# Altium schematic sheet PowerPanel_5_Fans_LEDs_IO.SchDoc
size 594 x 420 mm; SheetNumber: 6; SheetTotal: 6
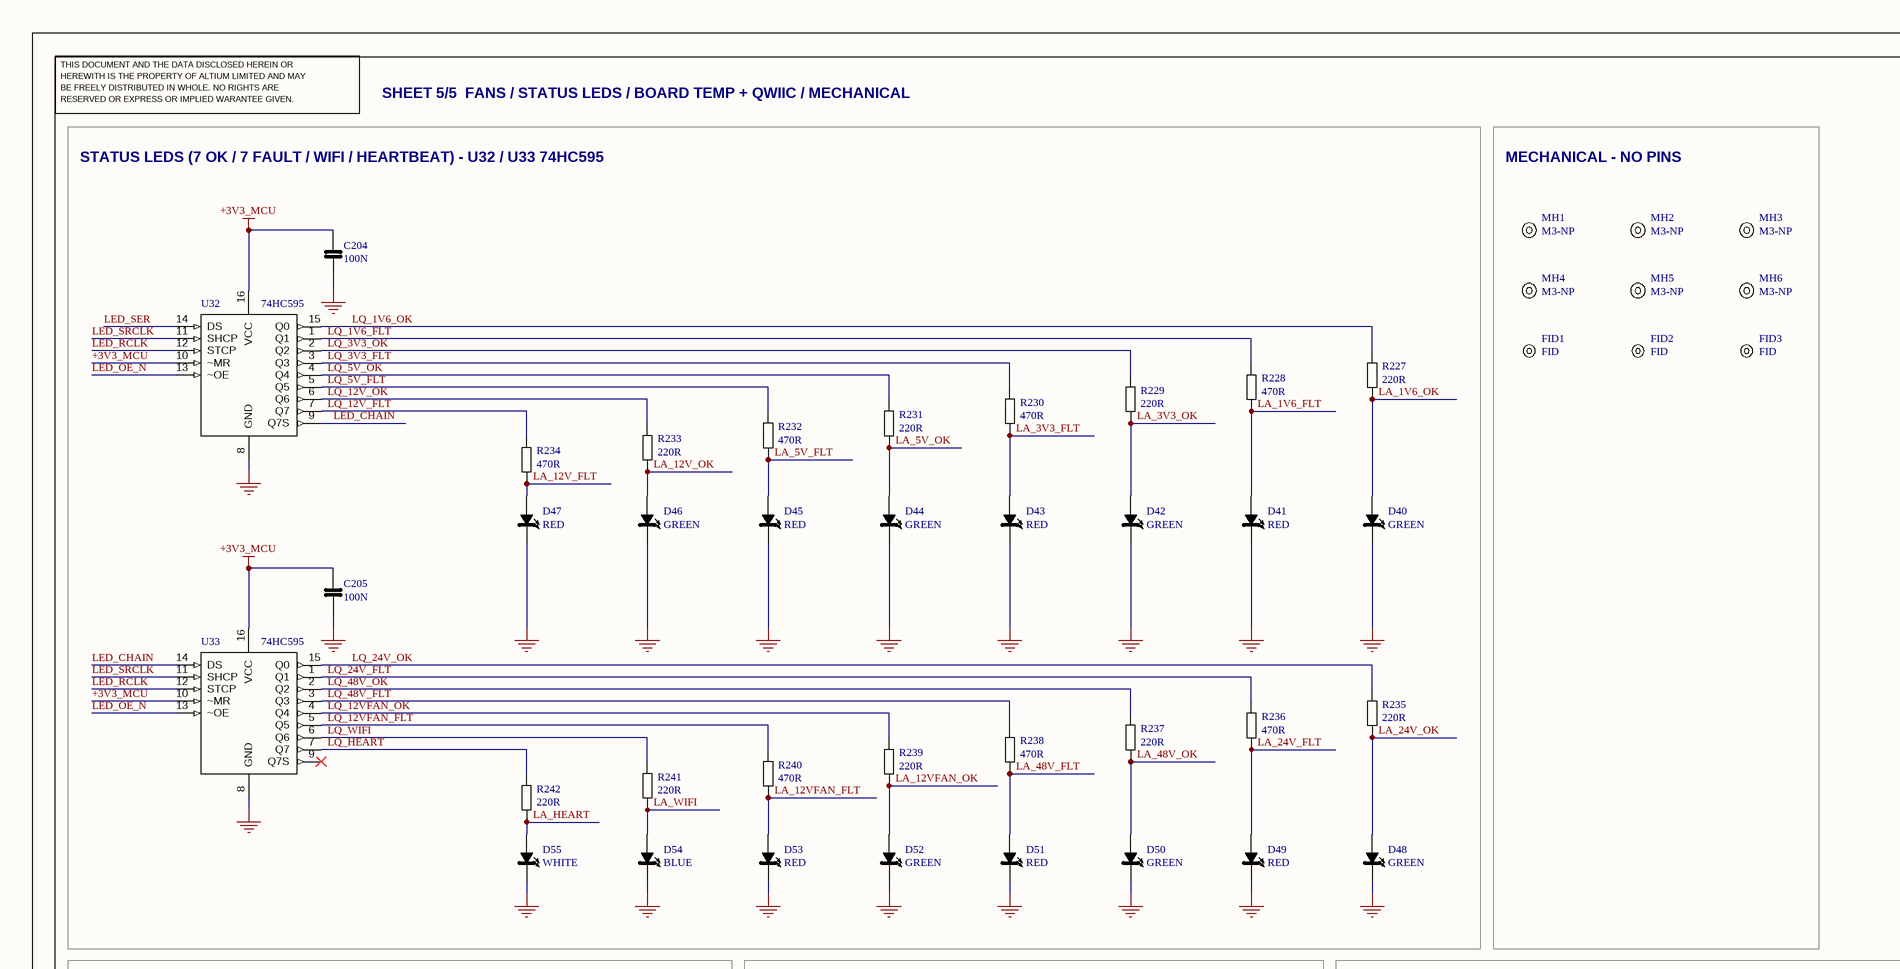
[diagram p0: PowerPanel_5_Fans_LEDs_IO.SchDoc, top left]
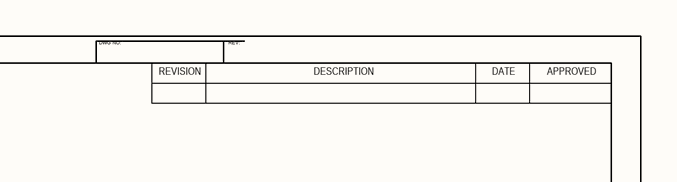
[diagram p1: PowerPanel_5_Fans_LEDs_IO.SchDoc, top right]
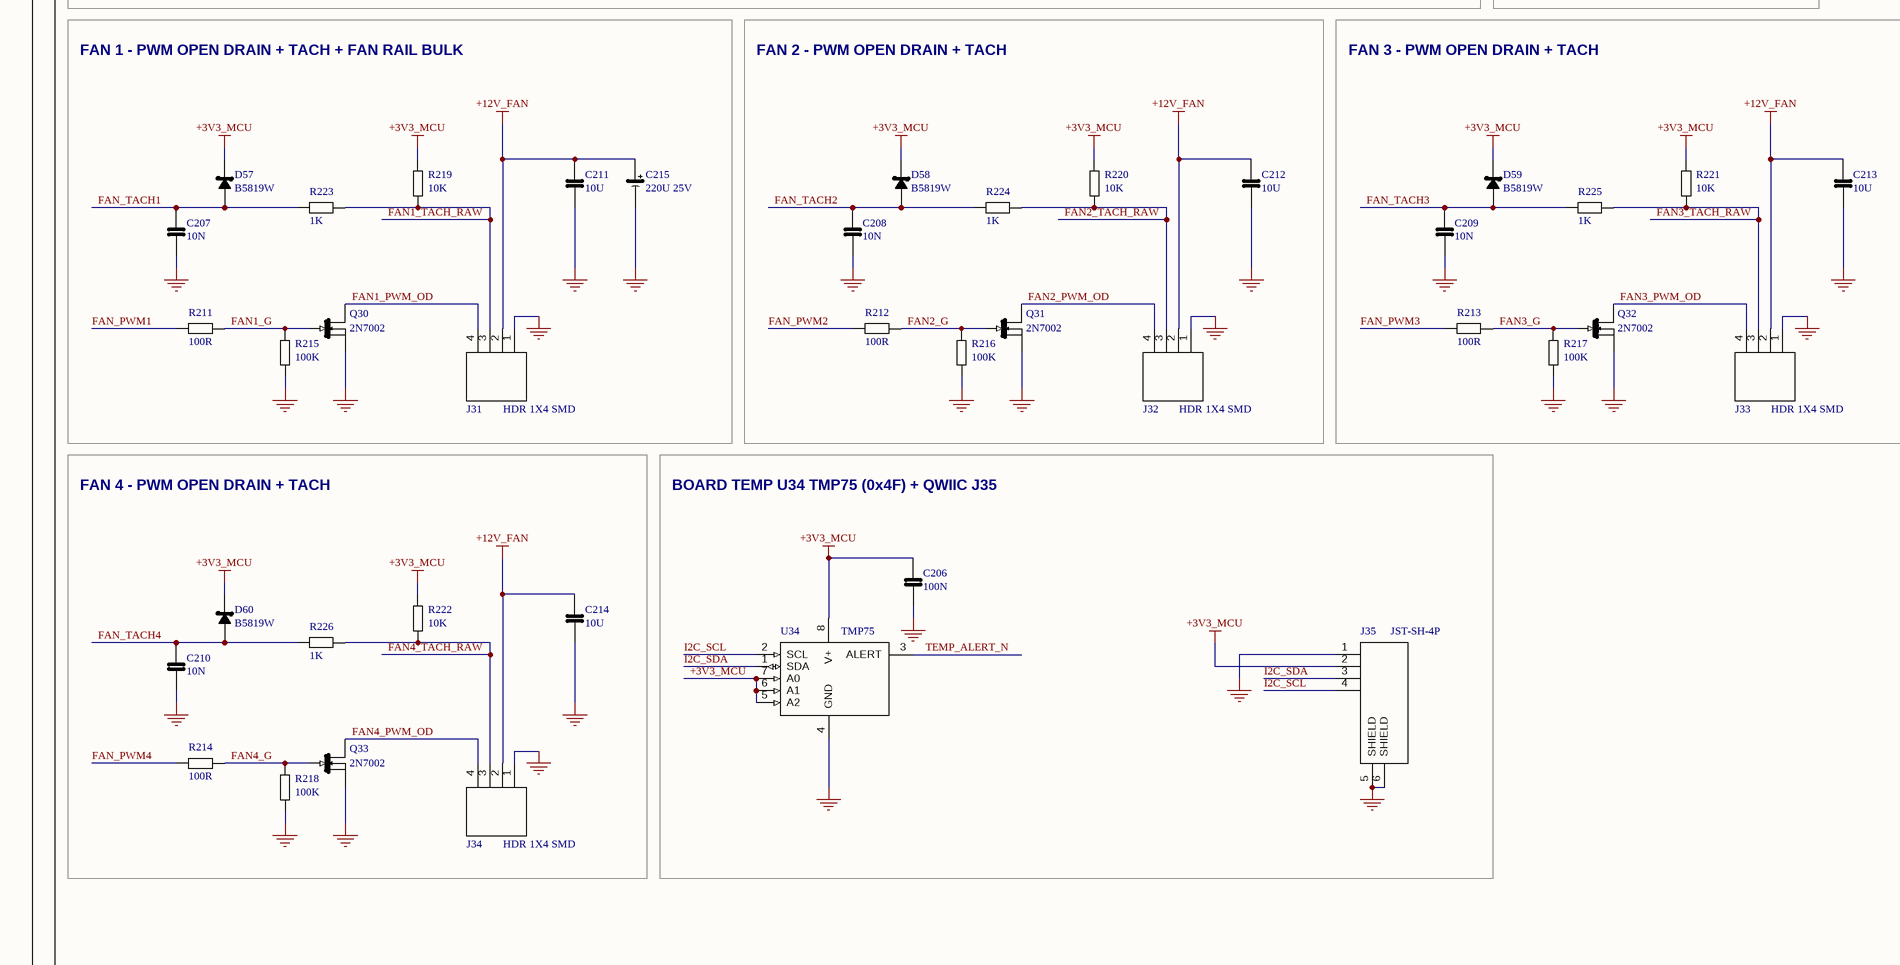
[diagram p2: PowerPanel_5_Fans_LEDs_IO.SchDoc, bottom left]
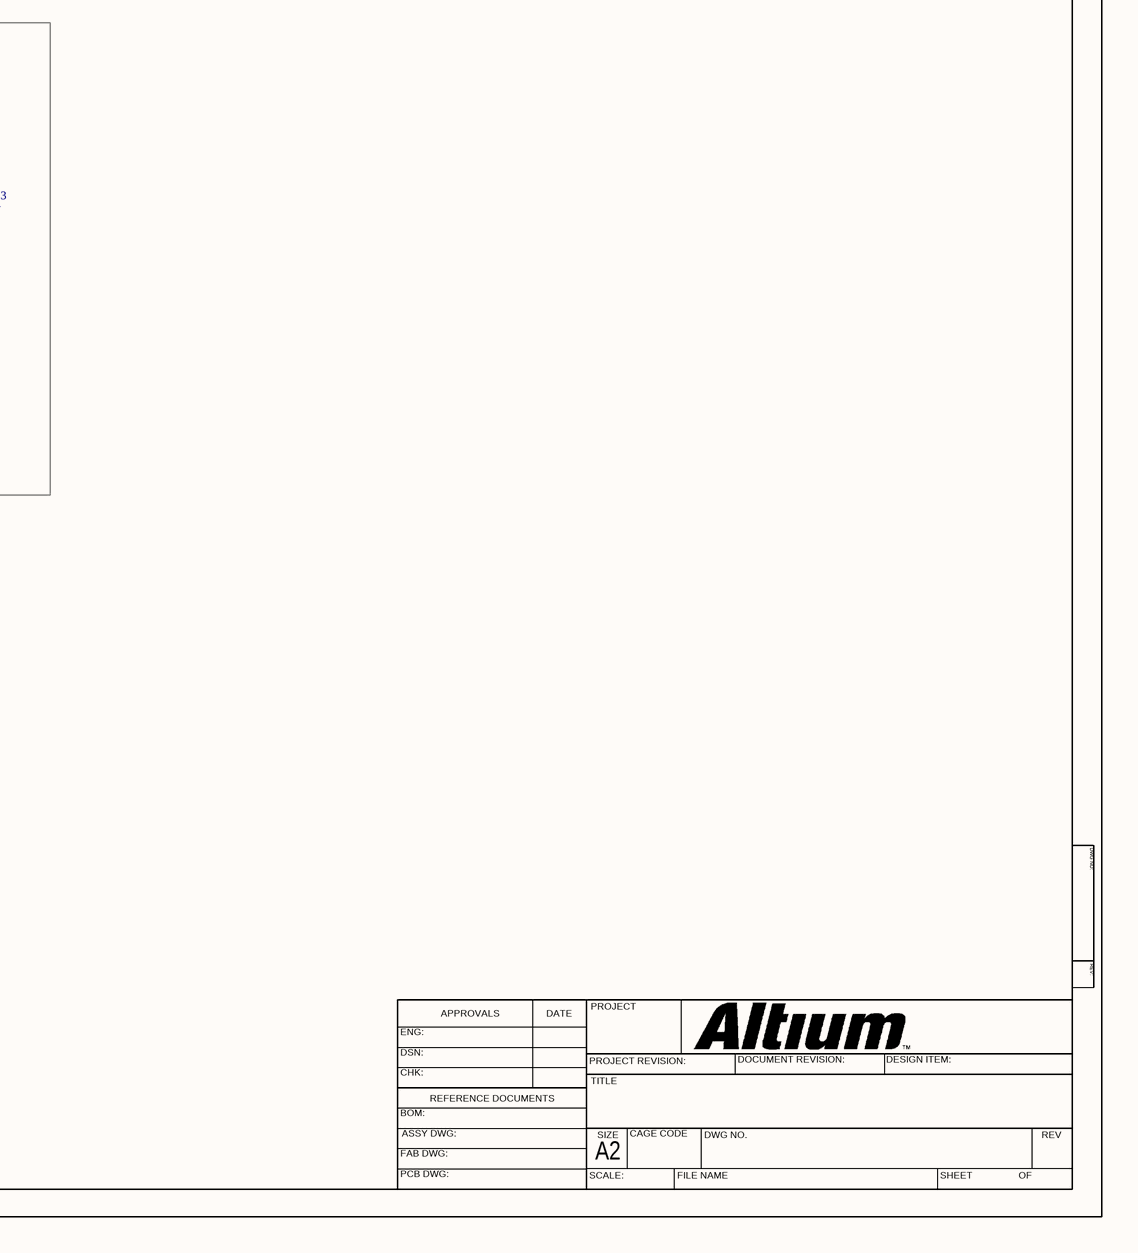
[diagram p3: PowerPanel_5_Fans_LEDs_IO.SchDoc, bottom right]

## Parts
C204  100N  [CAP0603]
C205  100N  [CAP0603]
C206  100N  [CAP0603]
C207  10N  [CAP0603]
C208  10N  [CAP0603]
C209  10N  [CAP0603]
C210  10N  [CAP0603]
C211  10U  [CAP0805]
C212  10U  [CAP0805]
C213  10U  [CAP0805]
C214  10U  [CAP0805]
C215  220U 25V  [CAPAE_D6.3X7.7]
D40  GREEN  [LED0603]
D41  RED  [LED0603]
D42  GREEN  [LED0603]
D43  RED  [LED0603]
D44  GREEN  [LED0603]
D45  RED  [LED0603]
D46  GREEN  [LED0603]
D47  RED  [LED0603]
D48  GREEN  [LED0603]
D49  RED  [LED0603]
D50  GREEN  [LED0603]
D51  RED  [LED0603]
D52  GREEN  [LED0603]
D53  RED  [LED0603]
D54  BLUE  [LED0603]
D55  WHITE  [LED0603]
D57  B5819W  [SOD-123]
D58  B5819W  [SOD-123]
D59  B5819W  [SOD-123]
D60  B5819W  [SOD-123]
FID1  FID  [FIDUCIAL_1MM]
FID2  FID  [FIDUCIAL_1MM]
FID3  FID  [FIDUCIAL_1MM]
J31  HDR 1X4 SMD  [HDR_1X04_M_2.54_SMD_STAG]
J32  HDR 1X4 SMD  [HDR_1X04_M_2.54_SMD_STAG]
J33  HDR 1X4 SMD  [HDR_1X04_M_2.54_SMD_STAG]
J34  HDR 1X4 SMD  [HDR_1X04_M_2.54_SMD_STAG]
J35  JST-SH-4P  [JST_SM04B-SRSS-TB]
MH1  M3-NP  [MH-M3-NP]
MH2  M3-NP  [MH-M3-NP]
MH3  M3-NP  [MH-M3-NP]
MH4  M3-NP  [MH-M3-NP]
MH5  M3-NP  [MH-M3-NP]
MH6  M3-NP  [MH-M3-NP]
Q30  2N7002  [SOT-23-3]
Q31  2N7002  [SOT-23-3]
Q32  2N7002  [SOT-23-3]
Q33  2N7002  [SOT-23-3]
R211  100R  [R0603]
R212  100R  [R0603]
R213  100R  [R0603]
R214  100R  [R0603]
R215  100K  [R0603]
R216  100K  [R0603]
R217  100K  [R0603]
R218  100K  [R0603]
R219  10K  [R0603]
R220  10K  [R0603]
R221  10K  [R0603]
R222  10K  [R0603]
R223  1K  [R0603]
R224  1K  [R0603]
R225  1K  [R0603]
R226  1K  [R0603]
R227  220R  [R0603]
R228  470R  [R0603]
R229  220R  [R0603]
R230  470R  [R0603]
R231  220R  [R0603]
R232  470R  [R0603]
R233  220R  [R0603]
R234  470R  [R0603]
R235  220R  [R0603]
R236  470R  [R0603]
R237  220R  [R0603]
R238  470R  [R0603]
R239  220R  [R0603]
R240  470R  [R0603]
R241  220R  [R0603]
R242  220R  [R0603]
U32  74HC595  [SOIC-16]
U33  74HC595  [SOIC-16]
U34  TMP75  [SOIC-8]

## Blocks framed on the sheet
MECHANICAL - NO PINS: FID1-FID3 MH1-MH6
FAN 1 - PWM OPEN DRAIN + TACH + FAN RAIL BULK: C207 C211 C215 D57 J31 Q30 R211 R215 R219 R223
FAN 2 - PWM OPEN DRAIN + TACH: C208 C212 D58 J32 Q31 R212 R216 R220 R224
FAN 3 - PWM OPEN DRAIN + TACH: C209 C213 D59 J33 Q32 R213 R217 R221 R225
FAN 4 - PWM OPEN DRAIN + TACH: C210 C214 D60 J34 Q33 R214 R218 R222 R226
BOARD TEMP U34 TMP75 (0x4F) + QWIIC J35: C206 J35 U34

## Nets
+3V3_MCU: C204.1 C205.1 C206.1 D57.1(K) D58.1(K) D59.1(K) D60.1(K) J35.2 R219.1 R220.1 R221.1 R222.1 U32.10(~MR) U32.16(VCC) U33.10(~MR) U33.16(VCC) U34.5(A2) U34.6(A1) U34.7(A0) U34.8(V+)
+12V_FAN: C211.1 C212.1 C213.1 C214.1 C215.1(+) J31.2 J32.2 J33.2 J34.2
GND: C204.2 C205.2 C206.2 C207.2 C208.2 C209.2 C210.2 C211.2 C212.2 C213.2 C214.2 C215.2(-) D40.1(K) D41.1(K) D42.1(K) D43.1(K) D44.1(K) D45.1(K) D46.1(K) D47.1(K) D48.1(K) D49.1(K) D50.1(K) D51.1(K) D52.1(K) D53.1(K) D54.1(K) D55.1(K) J31.1 J32.1 J33.1 J34.1 J35.1 J35.5(SHIELD) J35.6(SHIELD) Q30.2(S) Q31.2(S) Q32.2(S) Q33.2(S) R215.2 R216.2 R217.2 R218.2 U32.8(GND) U33.8(GND) U34.4(GND)
FAN1_G: Q30.1(G) R211.2 R215.1
FAN1_PWM_OD: J31.4 Q30.3(D)
FAN1_TACH_RAW: J31.3 R219.2 R223.1
FAN2_G: Q31.1(G) R212.2 R216.1
FAN2_PWM_OD: J32.4 Q31.3(D)
FAN2_TACH_RAW: J32.3 R220.2 R224.1
FAN3_G: Q32.1(G) R213.2 R217.1
FAN3_PWM_OD: J33.4 Q32.3(D)
FAN3_TACH_RAW: J33.3 R221.2 R225.1
FAN4_G: Q33.1(G) R214.2 R218.1
FAN4_PWM_OD: J34.4 Q33.3(D)
FAN4_TACH_RAW: J34.3 R222.2 R226.1
FAN_PWM1: R211.1
FAN_PWM2: R212.1
FAN_PWM3: R213.1
FAN_PWM4: R214.1
FAN_TACH1: C207.1 D57.2(A) R223.2
FAN_TACH2: C208.1 D58.2(A) R224.2
FAN_TACH3: C209.1 D59.2(A) R225.2
FAN_TACH4: C210.1 D60.2(A) R226.2
I2C_SCL: J35.4 U34.2(SCL)
I2C_SDA: J35.3 U34.1(SDA)
LA_1V6_FLT: D41.2(A) R228.2
LA_1V6_OK: D40.2(A) R227.2
LA_3V3_FLT: D43.2(A) R230.2
LA_3V3_OK: D42.2(A) R229.2
LA_5V_FLT: D45.2(A) R232.2
LA_5V_OK: D44.2(A) R231.2
LA_12V_FLT: D47.2(A) R234.2
LA_12V_OK: D46.2(A) R233.2
LA_12VFAN_FLT: D53.2(A) R240.2
LA_12VFAN_OK: D52.2(A) R239.2
LA_24V_FLT: D49.2(A) R236.2
LA_24V_OK: D48.2(A) R235.2
LA_48V_FLT: D51.2(A) R238.2
LA_48V_OK: D50.2(A) R237.2
LA_HEART: D55.2(A) R242.2
LA_WIFI: D54.2(A) R241.2
LED_CHAIN: U32.9(Q7S) U33.14(DS)
LED_OE_N: U32.13(~OE) U33.13(~OE)
LED_RCLK: U32.12(STCP) U33.12(STCP)
LED_SER: U32.14(DS)
LED_SRCLK: U32.11(SHCP) U33.11(SHCP)
LQ_1V6_FLT: R228.1 U32.1(Q1)
LQ_1V6_OK: R227.1 U32.15(Q0)
LQ_3V3_FLT: R230.1 U32.3(Q3)
LQ_3V3_OK: R229.1 U32.2(Q2)
LQ_5V_FLT: R232.1 U32.5(Q5)
LQ_5V_OK: R231.1 U32.4(Q4)
LQ_12V_FLT: R234.1 U32.7(Q7)
LQ_12V_OK: R233.1 U32.6(Q6)
LQ_12VFAN_FLT: R240.1 U33.5(Q5)
LQ_12VFAN_OK: R239.1 U33.4(Q4)
LQ_24V_FLT: R236.1 U33.1(Q1)
LQ_24V_OK: R235.1 U33.15(Q0)
LQ_48V_FLT: R238.1 U33.3(Q3)
LQ_48V_OK: R237.1 U33.2(Q2)
LQ_HEART: R242.1 U33.7(Q7)
LQ_WIFI: R241.1 U33.6(Q6)
TEMP_ALERT_N: U34.3(ALERT)

Not connected (* = marked no-connect by the designer): U33 9(Q7S)*

## Notes on the sheet
- DWG NO:
- REV:
- THIS DOCUMENT AND THE DATA DISCLOSED HEREIN OR
- HEREWITH IS THE PROPERTY OF ALTIUM LIMITED AND MAY
- BE FREELY DISTRIBUTED IN WHOLE. NO RIGHTS ARE
- RESERVED OR EXPRESS OR IMPLIED WARANTEE GIVEN.
- SHEET 5/5  FANS / STATUS LEDS / BOARD TEMP + QWIIC / MECHANICAL
- REVISION
- DESCRIPTION
- DATE
- APPROVED
- STATUS LEDS (7 OK / 7 FAULT / WIFI / HEARTBEAT) - U32 / U33 74HC595
- ENG:
- APPROVALS
- PROJECT
- DSN:
- CHK:
- REFERENCE DOCUMENTS
- PROJECT REVISION:
- TITLE
- DOCUMENT REVISION:
- DESIGN ITEM:
- BOM:
- FAB DWG:
- PCB DWG:
- ASSY DWG:
- SCALE:
- A2
- SIZE
- CAGE CODE
- FILE NAME
- DWG NO.
- SHEET
- OF
- REV

## Library data of the parts
C204-C206 = C_100N_0603: CAP // 100N // 50V // X7R // 0603; MFR: YAGEO; MPN: CC0603KRX7R9BB104; Value: 100N; LCSC: C14663; JLC_TYPE: BASIC; JLC_CHECKED: 2026-09-29 STOCK 55887132; Datasheet: https://www.lcsc.com/datasheet/lcsc_datasheet_2211101700_YAGEO-CC0603KRX7R9BB104_C14663.pdf
C207-C210 = C_10N_0603: CAP // 10N // 50V // X7R // 0603; MFR: FH (Guangdong Fenghua Advanced Tech); MPN: 0603B103K500NT; Value: 10N; LCSC: C57112; JLC_TYPE: BASIC; JLC_CHECKED: 2026-09-29 STOCK 6903861; Datasheet: https://www.lcsc.com/datasheet/lcsc_datasheet_2304140030_FH--Guangdong-Fenghua-Advanced-Tech-0603B103K500NT_C57112.pdf
C211-C214 = C_10U_0805: CAP // 10U // 25V // X5R // 0805; MFR: Samsung Electro-Mechanics; MPN: CL21A106KAYNNNE; Value: 10U; LCSC: C15850; JLC_TYPE: BASIC; JLC_CHECKED: 2026-09-29 STOCK 5145754; Datasheet: https://www.lcsc.com/datasheet/lcsc_datasheet_2304140030_Samsung-Electro-Mechanics-CL21A106KAYNNNE_C15850.pdf
C215 = CP_220U_25V_6.3X7.7: CAP ALU // 220U // 25V // 20% // 105C // SMD D6.3X7.7; MFR: jieerrui; MPN: JVJ25V220M6x8; Value: 220U; LCSC: C46550404; JLC_TYPE: EXTENDED; JLC_CHECKED: 2026-09-29 STOCK 314304; Datasheet: https://www.lcsc.com/datasheet/lcsc_datasheet_2504101957_jieerrui-JVJ16V470M6x8_C46550400.pdf
D40 D42 D44 D46 D48 D50 D52 = LED_GREEN_0603: LED // GREEN // 525NM // VF 3V3 // 0603; MFR: XINGLIGHT; MPN: XL-1608UGC-04; Value: GREEN; LCSC: C965804; JLC_TYPE: EXTENDED; JLC_CHECKED: 2026-09-29 STOCK 3738563; Datasheet: https://wmsc.lcsc.com/wmsc/upload/file/pdf/v2/lcsc/2402181505_XINGLIGHT-XL-1608UGC-04_C965804.pdf
D41 D43 D45 D47 D49 D51 D53 = LED_RED_0603: LED // RED // 615-630NM // VF 2V0 // 0603; MFR: Hubei KENTO Elec; MPN: KT-0603R; Value: RED; LCSC: C2286; JLC_TYPE: BASIC; JLC_CHECKED: 2026-09-29 STOCK 4928823; Datasheet: https://www.lcsc.com/datasheet/lcsc_datasheet_1810231112_Hubei-KENTO-Elec-KT-0603R_C2286.pdf
D54 = LED_BLUE_0603: LED // BLUE // 470NM // VF 3V3 // 0603; MFR: XINGLIGHT; MPN: XL-1608UBC-04; Value: BLUE; LCSC: C965807; JLC_TYPE: EXTENDED; JLC_CHECKED: 2026-09-29 STOCK 2281634; Datasheet: https://wmsc.lcsc.com/wmsc/upload/file/pdf/v2/lcsc/2402181505_XINGLIGHT-XL-1608UBC-04_C965807.pdf
D55 = LED_WHITE_0603: LED // WHITE // VF 2V6-3V1 // 0603; MFR: Hubei KENTO Elec; MPN: KT-0603W; Value: WHITE; LCSC: C2290; JLC_TYPE: BASIC; JLC_CHECKED: 2026-09-29 STOCK 2151535; Datasheet: https://www.lcsc.com/datasheet/lcsc_datasheet_2305091500_Hubei-KENTO-Elec-KT-0603W_C2290.pdf
D57-D60 = D_B5819W: SCHOTTKY // 40V 1A // 600MV // SOD-123; MFR: Jiangsu Changjing Electronics Technology Co., Ltd.; MPN: B5819W SL; Value: B5819W; LCSC: C8598; JLC_TYPE: BASIC; JLC_CHECKED: 2026-09-29 STOCK 545116; Datasheet: https://www.lcsc.com/datasheet/lcsc_datasheet_2304140030_Jiangsu-Changjing-Electronics-Technology-Co---Ltd--B5819W-SL_C8598.pdf
FID1-FID3 = FIDUCIAL: FID // 1.0MM // PNP REFERENCE // NOT A BOM PART; MPN: FIDUCIAL (NOT A BOM PART)
J31-J34 = J_HDR_1X04_M_2.54_SMD: CONN // HDR MALE 1X4 // 2.54MM // 3A // SMD VERT STAGGERED; MFR: HANXIA; MPN: HX PZ2.54-1x4P TP-YQ; Value: 1X4; LCSC: C41417361; JLC_TYPE: EXTENDED; JLC_CHECKED: 2026-10-03 STOCK 51826; Datasheet: https://wmsc.lcsc.com/wmsc/upload/file/pdf/v2/lcsc/2411220032_hanxia-HX-PZ2-54-1x4P-TP-YQ_C41417361.pdf
J35 = J_JST-SH_4P_SMD: CONN // JST-SH // 4P // 1.0MM // 1A 50V // SMD RA; MFR: JST; MPN: SM04B-SRSS-TB(LF)(SN); Value: 4P; LCSC: C160404; JLC_TYPE: EXTENDED; JLC_CHECKED: 2026-09-29 STOCK 37873; Datasheet: https://www.lcsc.com/datasheet/lcsc_datasheet_2304140030_JST-SM04B-SRSS-TB-LF-SN_C160404.pdf
MH1-MH6 = MH-M3-NP: MOUNT // M3 // NPTH // NO COPPER // NO PIN; MFR: HOUSE STANDARD; MPN: MH-M3-NP (NOT A BOM PART - SCREW HOLE); Value: M3
Q30-Q33 = Q_2N7002: NMOS // 60V // 115MA // 5R@10V // SOT-23; MFR: Jiangsu Changjing Electronics Technology Co., Ltd.; Value: 2N7002; MPN: 2N7002; LCSC: C8545; JLC_TYPE: BASIC; JLC_CHECKED: 2026-09-29 STOCK 1679919; Datasheet: https://www.lcsc.com/datasheet/lcsc_datasheet_2304140030_Jiangsu-Changjing-Electronics-Technology-Co---Ltd--2N7002_C8545.pdf
R211-R214 = R_100R_0603: RES // 100R // 1% // 100MW // 0603; MFR: UNI-ROYAL(Uniroyal Elec); MPN: 0603WAF1000T5E; Value: 100R; LCSC: C22775; JLC_TYPE: BASIC; JLC_CHECKED: 2026-09-29 STOCK 11791812; Datasheet: https://www.lcsc.com/datasheet/lcsc_datasheet_2411221126_UNI-ROYAL-Uniroyal-Elec-0603WAF1000T5E_C22775.pdf
R215-R218 = R_100K_0603: RES // 100K // 1% // 100MW // 0603; MFR: UNI-ROYAL(Uniroyal Elec); MPN: 0603WAF1003T5E; Value: 100K; LCSC: C25803; JLC_TYPE: BASIC; JLC_CHECKED: 2026-09-29 STOCK 22429301; Datasheet: https://www.lcsc.com/datasheet/lcsc_datasheet_2206010045_UNI-ROYAL-Uniroyal-Elec-0603WAF1003T5E_C25803.pdf
R219-R222 = R_10K_0603: RES // 10K // 1% // 100MW // 0603; MFR: UNI-ROYAL(Uniroyal Elec); MPN: 0603WAF1002T5E; Value: 10K; LCSC: C25804; JLC_TYPE: BASIC; JLC_CHECKED: 2026-09-29 STOCK 21309815; Datasheet: https://www.lcsc.com/datasheet/lcsc_datasheet_2206010045_UNI-ROYAL-Uniroyal-Elec-0603WAF1002T5E_C25804.pdf
R223-R226 = R_1K_0603: RES // 1K // 1% // 100MW // 0603; MFR: UNI-ROYAL(Uniroyal Elec); MPN: 0603WAF1001T5E; Value: 1K; LCSC: C21190; JLC_TYPE: BASIC; JLC_CHECKED: 2026-09-29 STOCK 22360355; Datasheet: https://www.lcsc.com/datasheet/lcsc_datasheet_2206010130_UNI-ROYAL-Uniroyal-Elec-0603WAF1001T5E_C21190.pdf
R227 R229 R231 R233 R235 R237 R239 R241 R242 = R_220R_0603: RES // 220R // 1% // 100MW // 0603; MFR: UNI-ROYAL(Uniroyal Elec); MPN: 0603WAF2200T5E; Value: 220R; LCSC: C22962; JLC_TYPE: BASIC; JLC_CHECKED: 2026-09-29 STOCK 1954862; Datasheet: https://www.lcsc.com/datasheet/lcsc_datasheet_2206010130_UNI-ROYAL-Uniroyal-Elec-0603WAF2200T5E_C22962.pdf
R228 R230 R232 R234 R236 R238 R240 = R_470R_0603: RES // 470R // 1% // 100MW // 0603; MFR: UNI-ROYAL(Uniroyal Elec); MPN: 0603WAF4700T5E; Value: 470R; LCSC: C23179; JLC_TYPE: BASIC; JLC_CHECKED: 2026-09-29 STOCK 6479808; Datasheet: https://www.lcsc.com/datasheet/lcsc_datasheet_2206010116_UNI-ROYAL-Uniroyal-Elec-0603WAF4700T5E_C23179.pdf
U32 U33 = U_74HC595: LOGIC // 8BIT SIPO SHIFT REG // 2V-6V // SOIC-16; MFR: Nexperia; MPN: 74HC595D,118; Value: 74HC595; LCSC: C5947; JLC_TYPE: BASIC; JLC_CHECKED: 2026-09-29 STOCK 375715; Datasheet: https://www.lcsc.com/datasheet/lcsc_datasheet_2407241044_Nexperia-74HC595D-118_C5947.pdf
U34 = U_TMP75: SENSOR // TEMP 12BIT +-1C // I2C 0X48-4F // 5V5 // SOIC-8; MFR: Texas Instruments; MPN: TMP75AIDR; Value: TMP75; LCSC: C30389; JLC_TYPE: EXTENDED; JLC_CHECKED: 2026-09-29 STOCK 17077; Datasheet: https://www.ti.com/lit/ds/symlink/tmp75.pdf